# Altium schematic sheet Connector_Section.SchDoc
size A4; DocumentNumber: 7; SheetNumber: 7; SheetTotal: 7
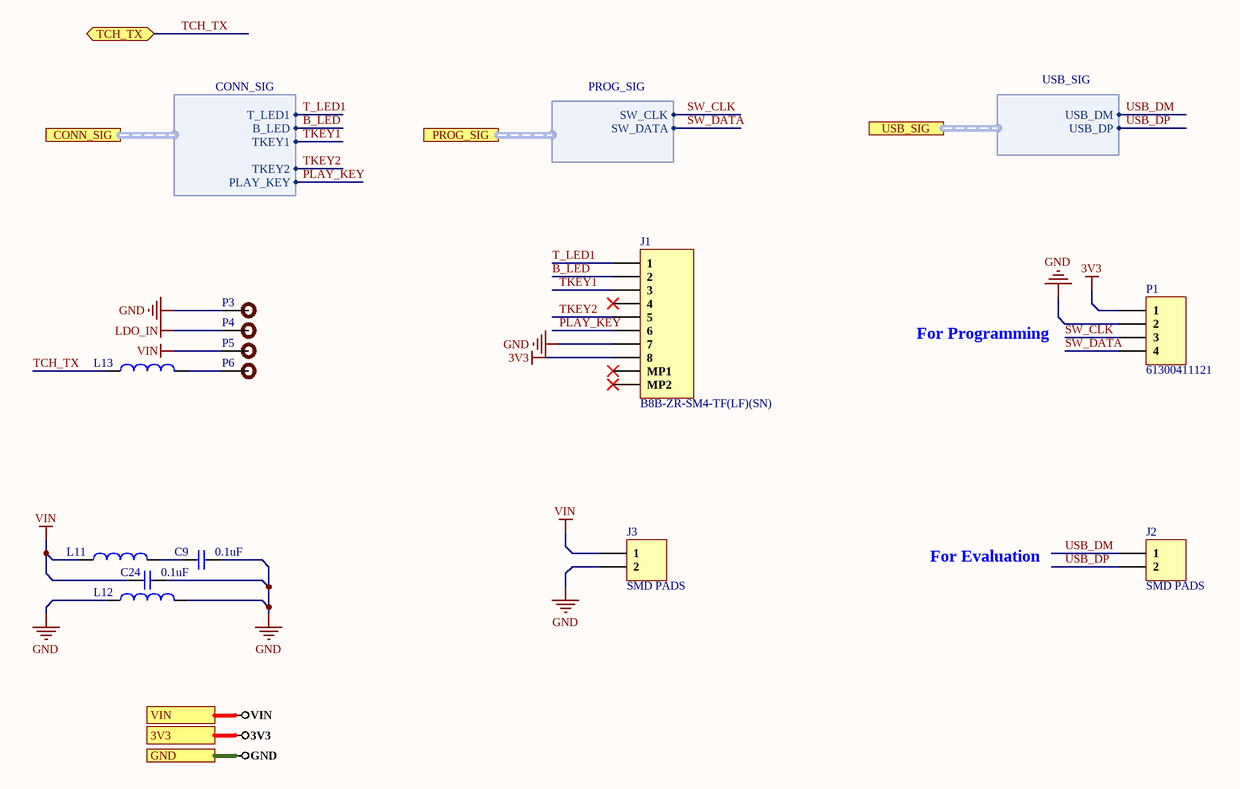
[diagram p0: Connector_Section.SchDoc]

## Parts
C9  0.1uF  [Cap0805]
C24  0.1uF  [Cap0805]
J1  B8B-ZR-SM4-TF(LF)(SN)  [B8B-ZR-SM4-TF(LF)(SN)]
J2  SMD PADS  [SMD PAD]
J3  SMD PADS  [SMD PAD]
L11  BLM18AG121SN1D  [BLM18AG121SN1D]  (value not drawn)
L12  BLM18AG121SN1D  [BLM18AG121SN1D]  (value not drawn)
L13  BLM18AG121SN1D  [BLM18AG121SN1D]  (value not drawn)
P1  61300411121  [HDR1X4]
P3  Test Point  [TEST POINT]  (value not drawn)
P4  Test Point  [TEST POINT]  (value not drawn)
P5  Test Point  [TEST POINT]  (value not drawn)
P6  Test Point  [TEST POINT]  (value not drawn)

## Ports
3V3, CONN_SIG (harness CONN_SIG), GND, PROG_SIG (harness PROG_SIG), TCH_TX (bidir), USB_SIG (harness USB_SIG), VIN

## Harnesses
CONN_SIG: T_LED1, B_LED, TKEY1, TKEY2, PLAY_KEY
PROG_SIG: SW_CLK, SW_DATA
USB_SIG: USB_DM, USB_DP

## Nets
3V3: J1.8 P1.1 ; port 3V3
GND: C9.2 C24.2 J1.7 J3.2 L12.1 L12.2 P1.2 P3.1 ; port GND
LDO_IN: P4.1
VIN: C24.1 J3.1 L11.1 P5.1 ; port VIN
B_LED: J1.2 ; port CONN_SIG.B_LED
PLAY_KEY: J1.6 ; port CONN_SIG.PLAY_KEY
SW_CLK: P1.3 ; port PROG_SIG.SW_CLK
SW_DATA: P1.4 ; port PROG_SIG.SW_DATA
T_LED1: J1.1 ; port CONN_SIG.T_LED1
TCH_TX: L13.1 ; port TCH_TX
TKEY1: J1.3 ; port CONN_SIG.TKEY1
TKEY2: J1.5 ; port CONN_SIG.TKEY2
USB_DM: J2.1 ; port USB_SIG.USB_DM
USB_DP: J2.2 ; port USB_SIG.USB_DP
NetC9_1: C9.1 L11.2
NetL13_2: L13.2 P6.1

Not connected (* = marked no-connect by the designer): J1 4* MP1* MP2*

## Notes on the sheet
- For Programming
- For Evaluation

## Library data of the parts
C9 C24 = 0805B104K500CT: CAP CER 0.1UF 50V X7R 0805; Manufacturer: Walsin Technologies; Tolerance: 10%; Capacitance: 100nF; Supplier 1: Digi-Key; Manufacturer Part Number: 0805B104K500CT; RoHS: Yes; Category: Ceramic Capacitors; Stock 1: 1274242; Pricing 1: 1=0.12000, 10=0.08600, 50=0.04900, 100=0.04050, 500=0.02842, 1000=0.02352 (USD); Case/Package: 0805; Case Code (Imperial): 0805; Case Code (Metric): 2012; Min Operating Temperature: -55°C; Max Operating Temperature: 125°C; Packaging: Tape and Reel; Voltage Rating: 50V; Dielectric: X7R; Voltage Rating (DC): 50V; Voltage: 50V; Length: 2mm; Depth: 1.25mm; Radiation Hardening: No; REACH SVHC: Unknown; Lead Free: Lead Free; ComponentLink1URL: http://www.farnell.com/datasheets/2340522.pdf?src-supplier=Farnell; ComponentLink1Description: http://www.farnell.com/datasheets/2340522.pdf?src-supplier=Farnell; ComponentLink2URL: http://components.arrow.com/part/dataview/0323_00650840?src-supplier=Arrow+Europe; ComponentLink2Description: http://components.arrow.com/part/dataview/0323_00650840?src-supplier=Arrow+Europe; ComponentLink3URL: https://www.verical.com/server-webapp/html/getDatasheet?partID=414849&src-supplier=Verical; ComponentLink3Description: https://www.verical.com/server-webapp/html/getDatasheet?partID=414849&src-supplier=Verical; ComponentLink4URL: http://www.farnell.com/datasheets/2340522.pdf?src-supplier=Element14; ComponentLink4Description: http://www.farnell.com/datasheets/2340522.pdf?src-supplier=Element14; ComponentLink5URL: http://www.passivecomponent.com/wp-content/uploads/2018/10/MLCC.pdf?src-supplier=Digi-Key; ComponentLink5Description: http://www.passivecomponent.com/wp-content/uploads/2018/10/MLCC.pdf?src-supplier=Digi-Key; ComponentLink6URL: http://www.passivecomponent.com/indexsea/0805B104K500CT-IB.pdf?src-supplier=Digi-Key; ComponentLink6Description: http://www.passivecomponent.com/indexsea/0805B104K500CT-IB.pdf?src-supplier=Digi-Key; ComponentLink7URL: http://www.farnell.com/datasheets/2340522.pdf?src-supplier=Newark; ComponentLink7Description: http://www.farnell.com/datasheets/2340522.pdf?src-supplier=Newark; Supplier Part Number 1: 1292-1647-1-ND
J1 = B8B-ZR-SM4-TF(LF)(SN): Conn Shrouded Header HDR 8 POS 1.5mm Solder ST SMD T/R; Manufacturer: JST; Number of Positions: 8; Connector Type: Male Pin; Current Rating: 1A; Gender: Male; Contact Resistance: 30mR; Max Voltage Rating (AC): 50V; Supplier 1: Digi-Key; Manufacturer Part Number: B8B-ZR-SM4-TF(LF)(SN); RoHS: Yes; Category: Board to Board Connectors; Pricing 1: 1=0.80000, 10=0.70700, 100=0.60970, 500=0.49886 (USD); Mount: Surface Mount; Contact Plating: Tin,Copper; Contact Material: Tin,Brass; Color: Natural; Housing Color: Beige; Housing Material: Polyamide; Min Operating Temperature: -25°C; Max Operating Temperature: 85°C; Number of Rows: 1; Packaging: Tape and Reel; Termination: Solder; Number of Contacts: 8; Max Current Rating: 1A; Fastening Type: Detent; Orientation: Right Angle; Length: 15mm; Width: 3.5mm; Height: 7.2mm; Pitch: 1.5mm; Depth: 6.5mm; Lead Free: Lead Free; ComponentLink1URL: https://datasheet.ciiva.com/26894/getdatasheetpartid-640747-26894507.pdf?src-supplier=Verical; ComponentLink1Description: https://datasheet.ciiva.com/26894/getdatasheetpartid-640747-26894507.pdf?src-supplier=Verical; ComponentLink2URL: https://datasheet.ciiva.com/16418/ezr-16418253.pdf?src-supplier=Future+Electronics; ComponentLink2Description: https://datasheet.ciiva.com/16418/ezr-16418253.pdf?src-supplier=Future+Electronics; Supplier Part Number 1: 455-1687-1-ND
J2 J3 = SMD PAD
L11-L13 = BLM18AG121SN1D: Ferrite Beads 120Ohm 25% 500mA 0603; Manufacturer: Murata; Material: Steel,Ferrite; Impedance: 120R; DC Resistance (DCR): 180mR; Test Frequency: 100MHz; Number of Lines: 1; Shielding: Unshielded; Supplier 1: Digi-Key; Manufacturer Part Number: BLM18AG121SN1D; RoHS: Yes; Category: Inductors; Stock 1: 1660; Pricing 1: 1=0.10000, 10=0.07900, 25=0.07200, 50=0.06480, 100=0.04760, 250=0.03460, 500=0.03170, 1000=0.02738 (USD); Case/Package: 0603; Number of Pins: 2; Core Material: Ferrite; Case Code (Metric): 1608; Case Code (Imperial): 0603; Min Operating Temperature: -55°C; Max Operating Temperature: 125°C; Tolerance: 25%; Max DC Current: 500mA; Package Quantity: 1; Max Current Rating: 500mA; Packaging: Tape and Reel; Current Rating: 500mA; Termination: SMD/SMT; DC Current: 500mA; Frequency: 100MHz; Number of Circuits: 1; Series: BLM18A; DC Resistance-Max: 180mR; Length: 1.6mm; Width: 0.8mm; Height: 0.8mm; Depth: 0.8mm; Radiation Hardening: No; REACH SVHC: No SVHC; Military Standard: Not; Lead Free: Lead Free; RoHS Compliant: Yes; ComponentLink1URL: https://datasheet.ciiva.com/11795/0900766b811b5866-11795382.pdf?src-supplier=RSComponents; ComponentLink1Description: https://datasheet.ciiva.com/11795/0900766b811b5866-11795382.pdf?src-supplier=RSComponents; ComponentLink2URL: https://datasheet.ciiva.com/19460/1844723-19460204.pdf?src-supplier=Jameco; ComponentLink2Description: https://datasheet.ciiva.com/19460/1844723-19460204.pdf?src-supplier=Jameco; ComponentLink3URL: https://datasheet.ciiva.com/29347/442268-da-01-en-chip-drossel-0603-120r-500ma-1-6x0-8mm-29347890.pdf?src-supplier=Conrad; ComponentLink3Description: https://datasheet.ciiva.com/29347/442268-da-01-en-chip-drossel-0603-120r-500ma-1-6x0-8mm-29347890.pdf?src-supplier=Conrad; ComponentLink4URL: https://datasheet.ciiva.com/41449/001172222-da-01-en-drossel-0603-120r-1-6x0-8mm-4000st-41449509.pdf?src-supplier=Conrad; ComponentLink4Description: https://datasheet.ciiva.com/41449/001172222-da-01-en-drossel-0603-120r-1-6x0-8mm-4000st-41449509.pdf?src-supplier=Conrad; ComponentLink5URL: https://datasheet.ciiva.com/14122/blm-series-eng-tds-14122902.pdf?src-supplier=Distrelec; ComponentLink5Description: https://datasheet.ciiva.com/14122/blm-series-eng-tds-14122902.pdf?src-supplier=Distrelec; ComponentLink6URL: https://datasheet.ciiva.com/17246/l0110s0100blm18a-17246919.pdf?src-supplier=Avnet+Europe; ComponentLink6Description: https://datasheet.ciiva.com/17246/l0110s0100blm18a-17246919.pdf?src-supplier=Avnet+Europe; ComponentLink7URL: https://datasheet.ciiva.com/3081/l0110s0100blm18a-3081610.pdf?src-supplier=Avnet; ComponentLink7Description: https://datasheet.ciiva.com/3081/l0110s0100blm18a-3081610.pdf?src-supplier=Avnet; ComponentLink8URL: https://datasheet.ciiva.com/1012/l0110s0100blm18a-1012011.pdf?src-supplier=Digi-Key; ComponentLink8Description: https://datasheet.ciiva.com/1012/l0110s0100blm18a-1012011.pdf?src-supplier=Digi-Key; ComponentLink9URL: https://datasheet.ciiva.com/1012/l0110s0100blm18a-1012012.pdf?src-supplier=Digi-Key; ComponentLink9Description: https://datasheet.ciiva.com/1012/l0110s0100blm18a-1012012.pdf?src-supplier=Digi-Key; ComponentLink10URL: https://datasheet.ciiva.com/8510/l0110s0100blm18a-8510156.pdf?src-supplier=Avnet; ComponentLink10Description: https://datasheet.ciiva.com/8510/l0110s0100blm18a-8510156.pdf?src-supplier=Avnet; ComponentLink11URL: https://datasheet.ciiva.com/1012/l0110s0100blm18a-1012013.pdf?src-supplier=Digi-Key; ComponentLink11Description: https://datasheet.ciiva.com/1012/l0110s0100blm18a-1012013.pdf?src-supplier=Digi-Key; ComponentLink12URL: https://datasheet.ciiva.com/16215/l0110s0100blm18a-16215230.pdf?src-supplier=Future+Electronics; ComponentLink12Description: https://datasheet.ciiva.com/16215/l0110s0100blm18a-16215230.pdf?src-supplier=Future+Electronics; Supplier Part Number 1: 490-1011-1-ND
P1 = Header 1x4: CONN HEADER VERT 4POS 2.54MM; Manufacturer: Wurth Electronics; Number of Positions: 4; Gender: Male; Connector Type: Male Pin; Pitch: 0.1inch; Supplier 1: Digi-Key; Manufacturer Part Number: 61300411121; Stock 1: 20544; Pricing 1: 1=0.18, 10=0.153, 25=0.1272, 50=0.106, 100=0.096, 1000=0.088 (USD); Mount: Through Hole; Contact Plating: Gold; Contact Material: Copper; Color: Black; Number of Rows: 1; Packaging: Bulk; Termination: Solder; Number of Contacts: 4; Contact Mating Length: 0.236inch; REACH SVHC: Unknown; Lead Free: Lead Free; ComponentLink1URL: http://www.farnell.com/cad/1737268.pdf?src-supplier=Element14; ComponentLink1Description: http://www.farnell.com/cad/1737268.pdf?src-supplier=Element14; ComponentLink2URL: https://katalog.we-online.de/em/datasheet/6130xx11121.pdf?src-supplier=Digi-Key; ComponentLink2Description: https://katalog.we-online.de/em/datasheet/6130xx11121.pdf?src-supplier=Digi-Key; Supplier Part Number 1: 732-5317-ND
P3-P6 = TEST POINT: Test Point ON